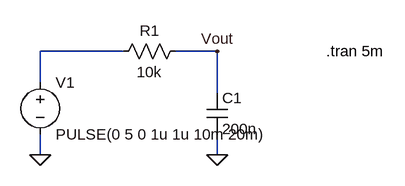
[diagram p0: schematic rc_spice_comparison.asc]
rc_spice_comparison.asc, the LTspice schematic file:
Version 4.1
SHEET 1 880 680
WIRE 96 64 -32 64
WIRE 240 64 176 64
WIRE -32 112 -32 64
WIRE 240 128 240 64
WIRE -32 224 -32 192
WIRE 240 224 240 192
FLAG -32 224 0
FLAG 240 224 0
FLAG 240 64 Vout
SYMBOL voltage -32 96 R0
WINDOW 123 0 0 Left 0
WINDOW 39 0 0 Left 0
SYMATTR InstName V1
SYMATTR Value PULSE(0 5 0 1u 1u 10m 20m)
SYMBOL res 192 48 R90
WINDOW 0 0 56 VBottom 2
WINDOW 3 32 56 VTop 2
SYMATTR InstName R1
SYMATTR Value 10k
SYMBOL cap 224 128 R0
SYMATTR InstName C1
SYMATTR Value 200n
TEXT 408 64 Left 2 !.tran 5m

The netlist it stands for:
* rc_spice_comparison.asc
V1 N001 0 PULSE(0 5 0 1u 1u 10m 20m)
R1 Vout N001 10k
C1 Vout 0 200n
.tran 5m
.backanno
.end